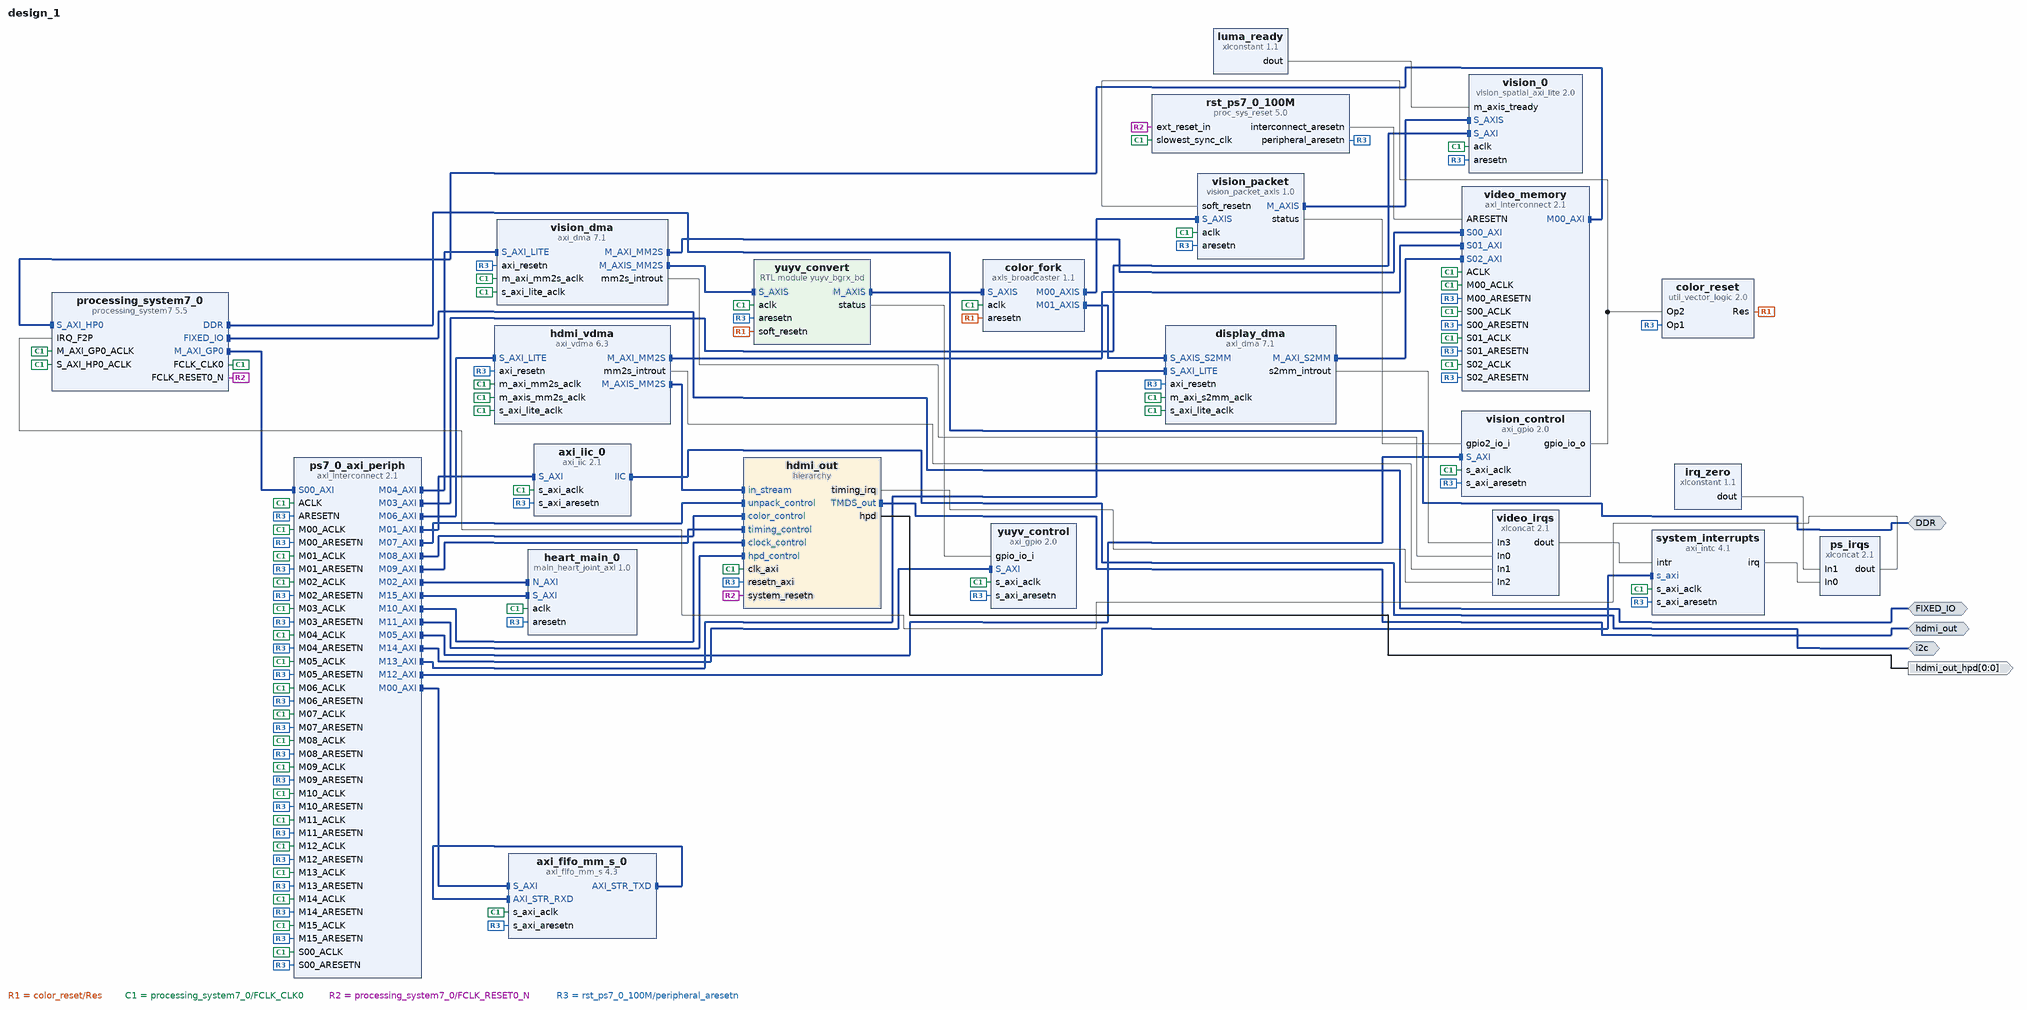
[diagram p0: block diagram of the top level]
# Vivado block design design_1, xc7z020clg400-1, Vivado 2024.1
create_bd_design design_1

create_bd_intf_port -mode Master -vlnv xilinx.com:interface:ddrx_rtl:1.0 DDR
create_bd_intf_port -mode Master -vlnv xilinx.com:display_processing_system7:fixedio_rtl:1.0 FIXED_IO
create_bd_intf_port -mode Master -vlnv xilinx.com:interface:iic_rtl:1.0 i2c
create_bd_intf_port -mode Master -vlnv digilentinc.com:interface:tmds_rtl:1.0 hdmi_out
create_bd_port -dir O -from 0 -to 0 hdmi_out_hpd

create_bd_cell -type ip -vlnv xilinx.com:ip:processing_system7:5.5 processing_system7_0
set_property -dict [list \
  CONFIG.PCW_APU_PERIPHERAL_FREQMHZ 650 \
  CONFIG.PCW_CRYSTAL_PERIPHERAL_FREQMHZ 50 \
  CONFIG.PCW_ENET0_ENET0_IO {MIO 16 .. 27} \
  CONFIG.PCW_ENET0_GRP_MDIO_ENABLE 1 \
  CONFIG.PCW_ENET0_GRP_MDIO_IO {MIO 52 .. 53} \
  CONFIG.PCW_ENET0_PERIPHERAL_ENABLE 1 \
  CONFIG.PCW_ENET0_RESET_ENABLE 1 \
  CONFIG.PCW_ENET0_RESET_IO {MIO 9} \
  CONFIG.PCW_ENET_RESET_ENABLE 1 \
  CONFIG.PCW_ENET_RESET_SELECT {Share reset pin} \
  CONFIG.PCW_FPGA0_PERIPHERAL_FREQMHZ 100 \
  CONFIG.PCW_FPGA1_PERIPHERAL_FREQMHZ 50 \
  CONFIG.PCW_GPIO_MIO_GPIO_ENABLE 1 \
  CONFIG.PCW_GPIO_MIO_GPIO_IO MIO \
  CONFIG.PCW_I2C_RESET_ENABLE 1 \
  CONFIG.PCW_IRQ_F2P_INTR 1 \
  CONFIG.PCW_PERIPHERAL_BOARD_PRESET None \
  CONFIG.PCW_PRESET_BANK1_VOLTAGE {LVCMOS 1.8V} \
  CONFIG.PCW_QSPI_GRP_FBCLK_ENABLE 1 \
  CONFIG.PCW_QSPI_GRP_FBCLK_IO {MIO 8} \
  CONFIG.PCW_QSPI_GRP_SINGLE_SS_ENABLE 1 \
  CONFIG.PCW_QSPI_GRP_SINGLE_SS_IO {MIO 1 .. 6} \
  CONFIG.PCW_QSPI_PERIPHERAL_ENABLE 1 \
  CONFIG.PCW_QSPI_QSPI_IO {MIO 1 .. 6} \
  CONFIG.PCW_SD0_GRP_CD_ENABLE 1 \
  CONFIG.PCW_SD0_GRP_CD_IO {MIO 47} \
  CONFIG.PCW_SD0_GRP_WP_ENABLE 0 \
  CONFIG.PCW_SD0_PERIPHERAL_ENABLE 1 \
  CONFIG.PCW_SD0_SD0_IO {MIO 40 .. 45} \
  CONFIG.PCW_SDIO_PERIPHERAL_FREQMHZ 50 \
  CONFIG.PCW_SINGLE_QSPI_DATA_MODE x4 \
  CONFIG.PCW_UART0_PERIPHERAL_ENABLE 1 \
  CONFIG.PCW_UART0_UART0_IO {MIO 14 .. 15} \
  CONFIG.PCW_UART1_PERIPHERAL_ENABLE 0 \
  CONFIG.PCW_UART_PERIPHERAL_FREQMHZ 100 \
  CONFIG.PCW_UIPARAM_DDR_BUS_WIDTH {16 Bit} \
  CONFIG.PCW_UIPARAM_DDR_FREQ_MHZ 525 \
  CONFIG.PCW_UIPARAM_DDR_PARTNO Custom \
  CONFIG.PCW_USB0_PERIPHERAL_ENABLE 1 \
  CONFIG.PCW_USB0_RESET_ENABLE 1 \
  CONFIG.PCW_USB0_RESET_IO {MIO 46} \
  CONFIG.PCW_USB0_USB0_IO {MIO 28 .. 39} \
  CONFIG.PCW_USB_RESET_ENABLE 1 \
  CONFIG.PCW_USB_RESET_SELECT {Share reset pin} \
  CONFIG.PCW_USE_FABRIC_INTERRUPT 1 \
  CONFIG.PCW_USE_S_AXI_HP0 1 \
] [get_bd_cells processing_system7_0]
# 494 more settings of processing_system7_0 are not shown: defaults, MIO pin electricals, DDR timing, and values the tool derives
create_bd_cell -type ip -vlnv xilinx.com:ip:axi_fifo_mm_s:4.3 axi_fifo_mm_s_0
create_bd_cell -type ip -vlnv xilinx.com:ip:axi_interconnect:2.1 ps7_0_axi_periph
set_property -dict {CONFIG.NUM_MI 16} [get_bd_cells ps7_0_axi_periph]
create_bd_cell -type ip -vlnv xilinx.com:ip:proc_sys_reset:5.0 rst_ps7_0_100M
create_bd_cell -type ip -vlnv xilinx.com:ip:axi_iic:2.1 axi_iic_0
set_property -dict {CONFIG.IIC_BOARD_INTERFACE i2c CONFIG.USE_BOARD_FLOW true} [get_bd_cells axi_iic_0]
create_bd_cell -type hier hdmi_out
create_bd_cell -type ip -vlnv xilinx.com:ip:axi_dma:7.1 vision_dma
set_property -dict [list \
  CONFIG.c_include_s2mm 0 \
  CONFIG.c_include_sg 0 \
  CONFIG.c_m_axi_mm2s_data_width 32 \
  CONFIG.c_m_axis_mm2s_tdata_width 32 \
  CONFIG.c_mm2s_burst_size 32 \
  CONFIG.c_sg_length_width 23 \
] [get_bd_cells vision_dma]
create_bd_cell -type ip -vlnv v3b25.local:vision:vision_packet_axis:1.0 vision_packet
create_bd_cell -type ip -vlnv xilinx.com:ip:axi_gpio:2.0 vision_control
set_property -dict [list \
  CONFIG.C_ALL_INPUTS_2 1 \
  CONFIG.C_ALL_OUTPUTS 1 \
  CONFIG.C_DOUT_DEFAULT 0x00000000 \
  CONFIG.C_GPIO2_WIDTH 32 \
  CONFIG.C_GPIO_WIDTH 1 \
  CONFIG.C_INTERRUPT_PRESENT 0 \
  CONFIG.C_IS_DUAL 1 \
] [get_bd_cells vision_control]
create_bd_cell -type ip -vlnv xilinx.com:ip:axi_vdma:6.3 hdmi_vdma
set_property -dict [list \
  CONFIG.c_include_s2mm 0 \
  CONFIG.c_m_axi_mm2s_data_width 32 \
  CONFIG.c_m_axis_mm2s_tdata_width 32 \
  CONFIG.c_mm2s_genlock_mode 1 \
  CONFIG.c_mm2s_linebuffer_depth 512 \
  CONFIG.c_mm2s_max_burst_length 32 \
  CONFIG.c_num_fstores 4 \
] [get_bd_cells hdmi_vdma]
create_bd_cell -type ip -vlnv xilinx.com:ip:axi_interconnect:2.1 video_memory
set_property -dict {CONFIG.NUM_MI 1 CONFIG.NUM_SI 3} [get_bd_cells video_memory]
create_bd_cell -type ip -vlnv xilinx.com:ip:axi_intc:4.1 system_interrupts
set_property -dict {CONFIG.C_IRQ_CONNECTION 1} [get_bd_cells system_interrupts]
create_bd_cell -type ip -vlnv xilinx.com:ip:xlconcat:2.1 video_irqs
set_property -dict {CONFIG.NUM_PORTS 4} [get_bd_cells video_irqs]
create_bd_cell -type ip -vlnv xilinx.com:ip:xlconcat:2.1 ps_irqs
set_property -dict {CONFIG.IN1_WIDTH 15 CONFIG.NUM_PORTS 2} [get_bd_cells ps_irqs]
create_bd_cell -type ip -vlnv xilinx.com:ip:xlconstant:1.1 irq_zero
set_property -dict {CONFIG.CONST_VAL 0 CONFIG.CONST_WIDTH 15} [get_bd_cells irq_zero]
create_bd_cell -type ip -vlnv xilinx.com:ip:xlconstant:1.1 luma_ready
set_property -dict {CONFIG.CONST_VAL 1} [get_bd_cells luma_ready]
create_bd_cell -type module -reference yuyv_bgrx_bd yuyv_convert
create_bd_cell -type ip -vlnv xilinx.com:ip:axis_broadcaster:1.1 color_fork
set_property -dict [list \
  CONFIG.HAS_TKEEP 1 \
  CONFIG.HAS_TLAST 1 \
  CONFIG.M00_TDATA_REMAP {tdata[31:0]} \
  CONFIG.M01_TDATA_REMAP {tdata[31:0]} \
  CONFIG.M_TDATA_NUM_BYTES 4 \
  CONFIG.NUM_MI 2 \
  CONFIG.S_TDATA_NUM_BYTES 4 \
] [get_bd_cells color_fork]
create_bd_cell -type ip -vlnv xilinx.com:ip:axi_dma:7.1 display_dma
set_property -dict [list \
  CONFIG.c_include_mm2s 0 \
  CONFIG.c_include_s2mm 1 \
  CONFIG.c_include_sg 0 \
  CONFIG.c_m_axi_s2mm_data_width 32 \
  CONFIG.c_s2mm_burst_size 32 \
  CONFIG.c_s_axis_s2mm_tdata_width 32 \
  CONFIG.c_sg_length_width 23 \
] [get_bd_cells display_dma]
create_bd_cell -type ip -vlnv xilinx.com:ip:axi_gpio:2.0 yuyv_control
set_property -dict {CONFIG.C_ALL_INPUTS 1 CONFIG.C_GPIO_WIDTH 32 CONFIG.C_INTERRUPT_PRESENT 0} [get_bd_cells yuyv_control]
create_bd_cell -type ip -vlnv xilinx.com:ip:util_vector_logic:2.0 color_reset
set_property -dict {CONFIG.C_OPERATION and CONFIG.C_SIZE 1} [get_bd_cells color_reset]
create_bd_cell -type ip -vlnv v3b25.local:signal:main_heart_joint_axi:1.0 heart_main_0
set_property -dict {CONFIG.WATCHDOG_CYCLES 2000000} [get_bd_cells heart_main_0]
create_bd_cell -type ip -vlnv v3b25.local:vision:vision_spatial_axi_lite:2.0 vision_0

# ---- hierarchy /hdmi_out ----
current_bd_instance /hdmi_out
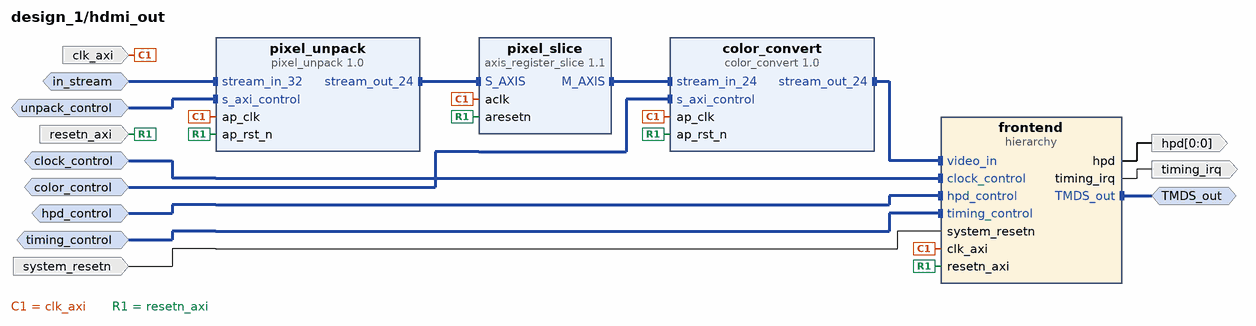
[diagram p1: block diagram inside /hdmi_out]
create_bd_intf_pin -mode Slave -vlnv xilinx.com:interface:aximm_rtl:1.0 hpd_control
create_bd_intf_pin -mode Slave -vlnv xilinx.com:interface:aximm_rtl:1.0 unpack_control
create_bd_intf_pin -mode Slave -vlnv xilinx.com:interface:aximm_rtl:1.0 color_control
create_bd_intf_pin -mode Slave -vlnv xilinx.com:interface:aximm_rtl:1.0 timing_control
create_bd_intf_pin -mode Slave -vlnv xilinx.com:interface:aximm_rtl:1.0 clock_control
create_bd_intf_pin -mode Slave -vlnv xilinx.com:interface:axis_rtl:1.0 in_stream
create_bd_intf_pin -mode Master -vlnv digilentinc.com:interface:tmds_rtl:1.0 TMDS_out
create_bd_pin -dir I -type clk clk_axi
create_bd_pin -dir I -type rst resetn_axi
create_bd_pin -dir I -type rst system_resetn
create_bd_pin -dir O -type intr timing_irq
create_bd_pin -dir O -from 0 -to 0 hpd

create_bd_cell -type ip -vlnv xilinx.com:hls:pixel_unpack:1.0 pixel_unpack
create_bd_cell -type ip -vlnv xilinx.com:hls:color_convert:1.0 color_convert
create_bd_cell -type ip -vlnv xilinx.com:ip:axis_register_slice:1.1 pixel_slice
set_property -dict {CONFIG.TUSER_WIDTH 1} [get_bd_cells pixel_slice]
create_bd_cell -type hier frontend

# ---- hierarchy /hdmi_out/frontend ----
current_bd_instance /hdmi_out/frontend
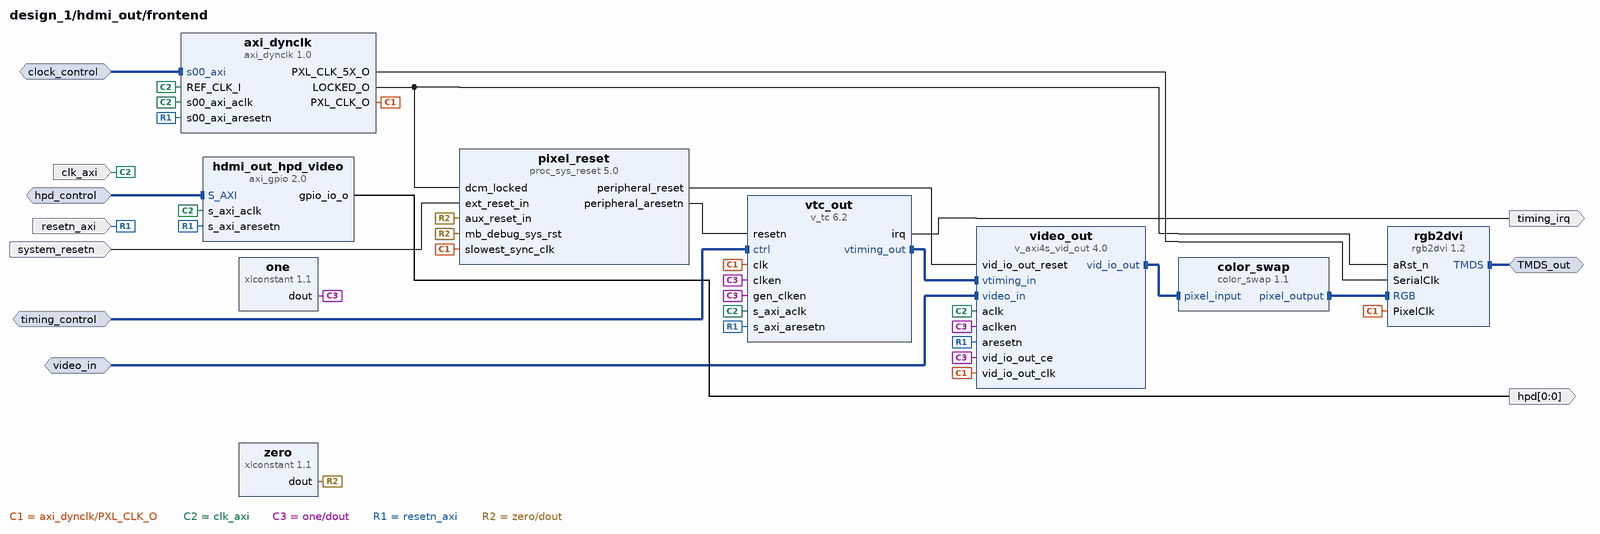
[diagram p2: block diagram inside /hdmi_out/frontend]
create_bd_intf_pin -mode Slave -vlnv xilinx.com:interface:aximm_rtl:1.0 hpd_control
create_bd_intf_pin -mode Slave -vlnv xilinx.com:interface:aximm_rtl:1.0 timing_control
create_bd_intf_pin -mode Slave -vlnv xilinx.com:interface:aximm_rtl:1.0 clock_control
create_bd_intf_pin -mode Slave -vlnv xilinx.com:interface:axis_rtl:1.0 video_in
create_bd_intf_pin -mode Master -vlnv digilentinc.com:interface:tmds_rtl:1.0 TMDS_out
create_bd_pin -dir I -type clk clk_axi
create_bd_pin -dir I -type rst resetn_axi
create_bd_pin -dir I -type rst system_resetn
create_bd_pin -dir O -type intr timing_irq
create_bd_pin -dir O -from 0 -to 0 hpd

create_bd_cell -type ip -vlnv digilentinc.com:ip:axi_dynclk:1.0 axi_dynclk
create_bd_cell -type ip -vlnv xilinx.com:user:color_swap:1.1 color_swap
create_bd_cell -type ip -vlnv xilinx.com:ip:axi_gpio:2.0 hdmi_out_hpd_video
set_property -dict {CONFIG.C_ALL_OUTPUTS 1 CONFIG.C_GPIO_WIDTH 1 CONFIG.C_INTERRUPT_PRESENT 0} [get_bd_cells hdmi_out_hpd_video]
create_bd_cell -type ip -vlnv digilentinc.com:ip:rgb2dvi:1.2 rgb2dvi
set_property -dict {CONFIG.kClkRange 2 CONFIG.kGenerateSerialClk false CONFIG.kRstActiveHigh false} [get_bd_cells rgb2dvi]
create_bd_cell -type ip -vlnv xilinx.com:ip:v_axi4s_vid_out:4.0 video_out
set_property -dict [list \
  CONFIG.C_ADDR_WIDTH 11 \
  CONFIG.C_HAS_ASYNC_CLK 1 \
  CONFIG.C_HYSTERESIS_LEVEL 1024 \
  CONFIG.C_VTG_MASTER_SLAVE 1 \
] [get_bd_cells video_out]
create_bd_cell -type ip -vlnv xilinx.com:ip:v_tc:6.2 vtc_out
set_property -dict {CONFIG.enable_detection false} [get_bd_cells vtc_out]
create_bd_cell -type ip -vlnv xilinx.com:ip:proc_sys_reset:5.0 pixel_reset
set_property -dict {CONFIG.C_AUX_RESET_HIGH 1} [get_bd_cells pixel_reset]
create_bd_cell -type ip -vlnv xilinx.com:ip:xlconstant:1.1 one
set_property -dict {CONFIG.CONST_VAL 1} [get_bd_cells one]
create_bd_cell -type ip -vlnv xilinx.com:ip:xlconstant:1.1 zero
set_property -dict {CONFIG.CONST_VAL 0} [get_bd_cells zero]

# ---- connections ----

current_bd_instance /hdmi_out
connect_bd_intf_net [get_bd_intf_pins clock_control] [get_bd_intf_pins frontend/clock_control]
connect_bd_intf_net [get_bd_intf_pins color_control] [get_bd_intf_pins color_convert/s_axi_control]
connect_bd_intf_net [get_bd_intf_pins color_convert/stream_out_24] [get_bd_intf_pins frontend/video_in]
connect_bd_intf_net [get_bd_intf_pins frontend/TMDS_out] [get_bd_intf_pins TMDS_out]
connect_bd_intf_net [get_bd_intf_pins hpd_control] [get_bd_intf_pins frontend/hpd_control]
connect_bd_intf_net [get_bd_intf_pins in_stream] [get_bd_intf_pins pixel_unpack/stream_in_32]
connect_bd_intf_net [get_bd_intf_pins pixel_slice/M_AXIS] [get_bd_intf_pins color_convert/stream_in_24]
connect_bd_intf_net [get_bd_intf_pins pixel_unpack/stream_out_24] [get_bd_intf_pins pixel_slice/S_AXIS]
connect_bd_intf_net [get_bd_intf_pins timing_control] [get_bd_intf_pins frontend/timing_control]
connect_bd_intf_net [get_bd_intf_pins unpack_control] [get_bd_intf_pins pixel_unpack/s_axi_control]
connect_bd_net [get_bd_pins clk_axi] \
  [get_bd_pins frontend/clk_axi] [get_bd_pins pixel_unpack/ap_clk] [get_bd_pins color_convert/ap_clk] \
  [get_bd_pins pixel_slice/aclk]
connect_bd_net [get_bd_pins frontend/hpd] [get_bd_pins hpd]
connect_bd_net [get_bd_pins frontend/timing_irq] [get_bd_pins timing_irq]
connect_bd_net [get_bd_pins resetn_axi] \
  [get_bd_pins frontend/resetn_axi] [get_bd_pins pixel_unpack/ap_rst_n] [get_bd_pins color_convert/ap_rst_n] \
  [get_bd_pins pixel_slice/aresetn]
connect_bd_net [get_bd_pins system_resetn] [get_bd_pins frontend/system_resetn]

current_bd_instance /hdmi_out/frontend
connect_bd_intf_net [get_bd_intf_pins clock_control] [get_bd_intf_pins axi_dynclk/s00_axi]
connect_bd_intf_net [get_bd_intf_pins color_swap/pixel_output] [get_bd_intf_pins rgb2dvi/RGB]
connect_bd_intf_net [get_bd_intf_pins hpd_control] [get_bd_intf_pins hdmi_out_hpd_video/S_AXI]
connect_bd_intf_net [get_bd_intf_pins rgb2dvi/TMDS] [get_bd_intf_pins TMDS_out]
connect_bd_intf_net [get_bd_intf_pins timing_control] [get_bd_intf_pins vtc_out/ctrl]
connect_bd_intf_net [get_bd_intf_pins video_in] [get_bd_intf_pins video_out/video_in]
connect_bd_intf_net [get_bd_intf_pins video_out/vid_io_out] [get_bd_intf_pins color_swap/pixel_input]
connect_bd_intf_net [get_bd_intf_pins vtc_out/vtiming_out] [get_bd_intf_pins video_out/vtiming_in]
connect_bd_net [get_bd_pins axi_dynclk/LOCKED_O] [get_bd_pins rgb2dvi/aRst_n] [get_bd_pins pixel_reset/dcm_locked]
connect_bd_net [get_bd_pins axi_dynclk/PXL_CLK_5X_O] [get_bd_pins rgb2dvi/SerialClk]
connect_bd_net [get_bd_pins axi_dynclk/PXL_CLK_O] \
  [get_bd_pins pixel_reset/slowest_sync_clk] [get_bd_pins rgb2dvi/PixelClk] [get_bd_pins video_out/vid_io_out_clk] \
  [get_bd_pins vtc_out/clk]
connect_bd_net [get_bd_pins clk_axi] \
  [get_bd_pins axi_dynclk/REF_CLK_I] [get_bd_pins axi_dynclk/s00_axi_aclk] [get_bd_pins hdmi_out_hpd_video/s_axi_aclk] \
  [get_bd_pins vtc_out/s_axi_aclk] [get_bd_pins video_out/aclk]
connect_bd_net [get_bd_pins hdmi_out_hpd_video/gpio_io_o] [get_bd_pins hpd]
connect_bd_net [get_bd_pins one/dout] \
  [get_bd_pins video_out/aclken] [get_bd_pins video_out/vid_io_out_ce] [get_bd_pins vtc_out/clken] \
  [get_bd_pins vtc_out/gen_clken]
connect_bd_net [get_bd_pins pixel_reset/peripheral_aresetn] [get_bd_pins vtc_out/resetn]
connect_bd_net [get_bd_pins pixel_reset/peripheral_reset] [get_bd_pins video_out/vid_io_out_reset]
connect_bd_net [get_bd_pins resetn_axi] \
  [get_bd_pins axi_dynclk/s00_axi_aresetn] [get_bd_pins hdmi_out_hpd_video/s_axi_aresetn] [get_bd_pins vtc_out/s_axi_aresetn] \
  [get_bd_pins video_out/aresetn]
connect_bd_net [get_bd_pins system_resetn] [get_bd_pins pixel_reset/ext_reset_in]
connect_bd_net [get_bd_pins vtc_out/irq] [get_bd_pins timing_irq]
connect_bd_net [get_bd_pins zero/dout] [get_bd_pins pixel_reset/aux_reset_in] [get_bd_pins pixel_reset/mb_debug_sys_rst]

current_bd_instance /
connect_bd_intf_net [get_bd_intf_pins axi_fifo_mm_s_0/AXI_STR_TXD] [get_bd_intf_pins axi_fifo_mm_s_0/AXI_STR_RXD]
connect_bd_intf_net [get_bd_intf_ports i2c] [get_bd_intf_pins axi_iic_0/IIC]
connect_bd_intf_net [get_bd_intf_pins color_fork/M00_AXIS] [get_bd_intf_pins vision_packet/S_AXIS]
connect_bd_intf_net [get_bd_intf_pins color_fork/M01_AXIS] [get_bd_intf_pins display_dma/S_AXIS_S2MM]
connect_bd_intf_net [get_bd_intf_pins display_dma/M_AXI_S2MM] [get_bd_intf_pins video_memory/S02_AXI]
connect_bd_intf_net [get_bd_intf_ports hdmi_out] [get_bd_intf_pins hdmi_out/TMDS_out]
connect_bd_intf_net [get_bd_intf_pins hdmi_vdma/M_AXIS_MM2S] [get_bd_intf_pins hdmi_out/in_stream]
connect_bd_intf_net [get_bd_intf_pins hdmi_vdma/M_AXI_MM2S] [get_bd_intf_pins video_memory/S01_AXI]
connect_bd_intf_net [get_bd_intf_ports DDR] [get_bd_intf_pins processing_system7_0/DDR]
connect_bd_intf_net [get_bd_intf_ports FIXED_IO] [get_bd_intf_pins processing_system7_0/FIXED_IO]
connect_bd_intf_net [get_bd_intf_pins processing_system7_0/M_AXI_GP0] [get_bd_intf_pins ps7_0_axi_periph/S00_AXI]
connect_bd_intf_net [get_bd_intf_pins ps7_0_axi_periph/M00_AXI] [get_bd_intf_pins axi_fifo_mm_s_0/S_AXI]
connect_bd_intf_net [get_bd_intf_pins ps7_0_axi_periph/M01_AXI] [get_bd_intf_pins axi_iic_0/S_AXI]
connect_bd_intf_net [get_bd_intf_pins ps7_0_axi_periph/M02_AXI] [get_bd_intf_pins heart_main_0/N_AXI]
connect_bd_intf_net [get_bd_intf_pins ps7_0_axi_periph/M03_AXI] [get_bd_intf_pins vision_0/S_AXI]
connect_bd_intf_net [get_bd_intf_pins ps7_0_axi_periph/M04_AXI] [get_bd_intf_pins vision_dma/S_AXI_LITE]
connect_bd_intf_net [get_bd_intf_pins ps7_0_axi_periph/M05_AXI] [get_bd_intf_pins vision_control/S_AXI]
connect_bd_intf_net [get_bd_intf_pins ps7_0_axi_periph/M06_AXI] [get_bd_intf_pins hdmi_vdma/S_AXI_LITE]
connect_bd_intf_net [get_bd_intf_pins ps7_0_axi_periph/M07_AXI] [get_bd_intf_pins hdmi_out/unpack_control]
connect_bd_intf_net [get_bd_intf_pins ps7_0_axi_periph/M08_AXI] [get_bd_intf_pins hdmi_out/color_control]
connect_bd_intf_net [get_bd_intf_pins ps7_0_axi_periph/M09_AXI] [get_bd_intf_pins hdmi_out/timing_control]
connect_bd_intf_net [get_bd_intf_pins ps7_0_axi_periph/M10_AXI] [get_bd_intf_pins hdmi_out/clock_control]
connect_bd_intf_net [get_bd_intf_pins ps7_0_axi_periph/M11_AXI] [get_bd_intf_pins hdmi_out/hpd_control]
connect_bd_intf_net [get_bd_intf_pins ps7_0_axi_periph/M12_AXI] [get_bd_intf_pins system_interrupts/s_axi]
connect_bd_intf_net [get_bd_intf_pins ps7_0_axi_periph/M13_AXI] [get_bd_intf_pins display_dma/S_AXI_LITE]
connect_bd_intf_net [get_bd_intf_pins ps7_0_axi_periph/M14_AXI] [get_bd_intf_pins yuyv_control/S_AXI]
connect_bd_intf_net [get_bd_intf_pins ps7_0_axi_periph/M15_AXI] [get_bd_intf_pins heart_main_0/S_AXI]
connect_bd_intf_net [get_bd_intf_pins video_memory/M00_AXI] [get_bd_intf_pins processing_system7_0/S_AXI_HP0]
connect_bd_intf_net [get_bd_intf_pins vision_dma/M_AXIS_MM2S] [get_bd_intf_pins yuyv_convert/S_AXIS]
connect_bd_intf_net [get_bd_intf_pins vision_dma/M_AXI_MM2S] [get_bd_intf_pins video_memory/S00_AXI]
connect_bd_intf_net [get_bd_intf_pins vision_packet/M_AXIS] [get_bd_intf_pins vision_0/S_AXIS]
connect_bd_intf_net [get_bd_intf_pins yuyv_convert/M_AXIS] [get_bd_intf_pins color_fork/S_AXIS]
connect_bd_net [get_bd_pins color_reset/Res] [get_bd_pins yuyv_convert/soft_resetn] [get_bd_pins color_fork/aresetn]
connect_bd_net [get_bd_pins display_dma/s2mm_introut] [get_bd_pins video_irqs/In3]
connect_bd_net [get_bd_pins hdmi_out/hpd] [get_bd_ports hdmi_out_hpd]
connect_bd_net [get_bd_pins hdmi_out/timing_irq] [get_bd_pins video_irqs/In2]
connect_bd_net [get_bd_pins hdmi_vdma/mm2s_introut] [get_bd_pins video_irqs/In1]
connect_bd_net [get_bd_pins irq_zero/dout] [get_bd_pins ps_irqs/In1]
connect_bd_net [get_bd_pins luma_ready/dout] [get_bd_pins vision_0/m_axis_tready]
connect_bd_net [get_bd_pins processing_system7_0/FCLK_CLK0] \
  [get_bd_pins processing_system7_0/M_AXI_GP0_ACLK] [get_bd_pins ps7_0_axi_periph/S00_ACLK] \
  [get_bd_pins rst_ps7_0_100M/slowest_sync_clk] [get_bd_pins axi_fifo_mm_s_0/s_axi_aclk] \
  [get_bd_pins ps7_0_axi_periph/M00_ACLK] [get_bd_pins ps7_0_axi_periph/ACLK] [get_bd_pins axi_iic_0/s_axi_aclk] \
  [get_bd_pins ps7_0_axi_periph/M01_ACLK] [get_bd_pins ps7_0_axi_periph/M02_ACLK] [get_bd_pins ps7_0_axi_periph/M03_ACLK] \
  [get_bd_pins vision_dma/s_axi_lite_aclk] [get_bd_pins ps7_0_axi_periph/M04_ACLK] [get_bd_pins vision_control/s_axi_aclk] \
  [get_bd_pins ps7_0_axi_periph/M05_ACLK] [get_bd_pins hdmi_vdma/s_axi_lite_aclk] [get_bd_pins ps7_0_axi_periph/M06_ACLK] \
  [get_bd_pins hdmi_out/clk_axi] [get_bd_pins ps7_0_axi_periph/M07_ACLK] [get_bd_pins ps7_0_axi_periph/M08_ACLK] \
  [get_bd_pins ps7_0_axi_periph/M09_ACLK] [get_bd_pins ps7_0_axi_periph/M10_ACLK] [get_bd_pins ps7_0_axi_periph/M11_ACLK] \
  [get_bd_pins system_interrupts/s_axi_aclk] [get_bd_pins ps7_0_axi_periph/M12_ACLK] [get_bd_pins vision_packet/aclk] \
  [get_bd_pins vision_dma/m_axi_mm2s_aclk] [get_bd_pins hdmi_vdma/m_axi_mm2s_aclk] [get_bd_pins hdmi_vdma/m_axis_mm2s_aclk] \
  [get_bd_pins video_memory/ACLK] [get_bd_pins video_memory/S00_ACLK] [get_bd_pins video_memory/S01_ACLK] \
  [get_bd_pins video_memory/M00_ACLK] [get_bd_pins processing_system7_0/S_AXI_HP0_ACLK] [get_bd_pins yuyv_convert/aclk] \
  [get_bd_pins color_fork/aclk] [get_bd_pins display_dma/s_axi_lite_aclk] [get_bd_pins display_dma/m_axi_s2mm_aclk] \
  [get_bd_pins yuyv_control/s_axi_aclk] [get_bd_pins ps7_0_axi_periph/M13_ACLK] [get_bd_pins ps7_0_axi_periph/M14_ACLK] \
  [get_bd_pins video_memory/S02_ACLK] [get_bd_pins ps7_0_axi_periph/M15_ACLK] [get_bd_pins heart_main_0/aclk] \
  [get_bd_pins vision_0/aclk]
connect_bd_net [get_bd_pins processing_system7_0/FCLK_RESET0_N] [get_bd_pins rst_ps7_0_100M/ext_reset_in] [get_bd_pins hdmi_out/system_resetn]
connect_bd_net [get_bd_pins ps_irqs/dout] [get_bd_pins processing_system7_0/IRQ_F2P]
connect_bd_net [get_bd_pins rst_ps7_0_100M/interconnect_aresetn] [get_bd_pins video_memory/ARESETN]
connect_bd_net [get_bd_pins rst_ps7_0_100M/peripheral_aresetn] \
  [get_bd_pins ps7_0_axi_periph/S00_ARESETN] [get_bd_pins axi_fifo_mm_s_0/s_axi_aresetn] \
  [get_bd_pins ps7_0_axi_periph/M00_ARESETN] [get_bd_pins ps7_0_axi_periph/ARESETN] [get_bd_pins axi_iic_0/s_axi_aresetn] \
  [get_bd_pins ps7_0_axi_periph/M01_ARESETN] [get_bd_pins ps7_0_axi_periph/M02_ARESETN] \
  [get_bd_pins ps7_0_axi_periph/M03_ARESETN] [get_bd_pins vision_dma/axi_resetn] [get_bd_pins ps7_0_axi_periph/M04_ARESETN] \
  [get_bd_pins vision_control/s_axi_aresetn] [get_bd_pins ps7_0_axi_periph/M05_ARESETN] [get_bd_pins hdmi_vdma/axi_resetn] \
  [get_bd_pins ps7_0_axi_periph/M06_ARESETN] [get_bd_pins hdmi_out/resetn_axi] [get_bd_pins ps7_0_axi_periph/M07_ARESETN] \
  [get_bd_pins ps7_0_axi_periph/M08_ARESETN] [get_bd_pins ps7_0_axi_periph/M09_ARESETN] \
  [get_bd_pins ps7_0_axi_periph/M10_ARESETN] [get_bd_pins ps7_0_axi_periph/M11_ARESETN] \
  [get_bd_pins system_interrupts/s_axi_aresetn] [get_bd_pins ps7_0_axi_periph/M12_ARESETN] \
  [get_bd_pins vision_packet/aresetn] [get_bd_pins video_memory/S00_ARESETN] [get_bd_pins video_memory/S01_ARESETN] \
  [get_bd_pins video_memory/M00_ARESETN] [get_bd_pins yuyv_convert/aresetn] [get_bd_pins display_dma/axi_resetn] \
  [get_bd_pins yuyv_control/s_axi_aresetn] [get_bd_pins ps7_0_axi_periph/M13_ARESETN] \
  [get_bd_pins ps7_0_axi_periph/M14_ARESETN] [get_bd_pins video_memory/S02_ARESETN] [get_bd_pins color_reset/Op1] \
  [get_bd_pins ps7_0_axi_periph/M15_ARESETN] [get_bd_pins heart_main_0/aresetn] [get_bd_pins vision_0/aresetn]
connect_bd_net [get_bd_pins system_interrupts/irq] [get_bd_pins ps_irqs/In0]
connect_bd_net [get_bd_pins video_irqs/dout] [get_bd_pins system_interrupts/intr]
connect_bd_net [get_bd_pins vision_control/gpio_io_o] [get_bd_pins vision_packet/soft_resetn] [get_bd_pins color_reset/Op2]
connect_bd_net [get_bd_pins vision_dma/mm2s_introut] [get_bd_pins video_irqs/In0]
connect_bd_net [get_bd_pins vision_packet/status] [get_bd_pins vision_control/gpio2_io_i]
connect_bd_net [get_bd_pins yuyv_convert/status] [get_bd_pins yuyv_control/gpio_io_i]

# ---- address map ----
assign_bd_address -offset 0x00000000 -range 512M -target_address_space [get_bd_addr_spaces display_dma/Data_S2MM] [get_bd_addr_segs processing_system7_0/S_AXI_HP0/HP0_DDR_LOWOCM]
assign_bd_address -offset 0x00000000 -range 512M -target_address_space [get_bd_addr_spaces hdmi_vdma/Data_MM2S] [get_bd_addr_segs processing_system7_0/S_AXI_HP0/HP0_DDR_LOWOCM]
assign_bd_address -offset 0x41230000 -range 64K -target_address_space [get_bd_addr_spaces processing_system7_0/Data] [get_bd_addr_segs hdmi_out/frontend/hdmi_out_hpd_video/S_AXI/Reg]
assign_bd_address -offset 0x41240000 -range 64K -target_address_space [get_bd_addr_spaces processing_system7_0/Data] [get_bd_addr_segs vision_control/S_AXI/Reg]
assign_bd_address -offset 0x41250000 -range 64K -target_address_space [get_bd_addr_spaces processing_system7_0/Data] [get_bd_addr_segs yuyv_control/S_AXI/Reg]
assign_bd_address -offset 0x41600000 -range 64K -target_address_space [get_bd_addr_spaces processing_system7_0/Data] [get_bd_addr_segs axi_iic_0/S_AXI/Reg]
assign_bd_address -offset 0x41800000 -range 64K -target_address_space [get_bd_addr_spaces processing_system7_0/Data] [get_bd_addr_segs system_interrupts/S_AXI/Reg]
assign_bd_address -offset 0x43000000 -range 64K -target_address_space [get_bd_addr_spaces processing_system7_0/Data] [get_bd_addr_segs hdmi_vdma/S_AXI_LITE/Reg]
assign_bd_address -offset 0x43C00000 -range 64K -target_address_space [get_bd_addr_spaces processing_system7_0/Data] [get_bd_addr_segs axi_fifo_mm_s_0/S_AXI/Mem0]
assign_bd_address -offset 0x43C10000 -range 64K -target_address_space [get_bd_addr_spaces processing_system7_0/Data] [get_bd_addr_segs heart_main_0/N_AXI/Reg]
assign_bd_address -offset 0x43C20000 -range 64K -target_address_space [get_bd_addr_spaces processing_system7_0/Data] [get_bd_addr_segs hdmi_out/frontend/vtc_out/ctrl/Reg]
assign_bd_address -offset 0x43C60000 -range 64K -target_address_space [get_bd_addr_spaces processing_system7_0/Data] [get_bd_addr_segs hdmi_out/color_convert/s_axi_control/Reg]
assign_bd_address -offset 0x43C70000 -range 64K -target_address_space [get_bd_addr_spaces processing_system7_0/Data] [get_bd_addr_segs hdmi_out/pixel_unpack/s_axi_control/Reg]
assign_bd_address -offset 0x43C80000 -range 64K -target_address_space [get_bd_addr_spaces processing_system7_0/Data] [get_bd_addr_segs vision_0/S_AXI/Reg]
assign_bd_address -offset 0x43C90000 -range 64K -target_address_space [get_bd_addr_spaces processing_system7_0/Data] [get_bd_addr_segs hdmi_out/frontend/axi_dynclk/s00_axi/reg0]
assign_bd_address -offset 0x43CA0000 -range 64K -target_address_space [get_bd_addr_spaces processing_system7_0/Data] [get_bd_addr_segs heart_main_0/S_AXI/Reg]
assign_bd_address -offset 0x44A00000 -range 64K -target_address_space [get_bd_addr_spaces processing_system7_0/Data] [get_bd_addr_segs vision_dma/S_AXI_LITE/Reg]
assign_bd_address -offset 0x44A10000 -range 64K -target_address_space [get_bd_addr_spaces processing_system7_0/Data] [get_bd_addr_segs display_dma/S_AXI_LITE/Reg]
assign_bd_address -offset 0x00000000 -range 512M -target_address_space [get_bd_addr_spaces vision_dma/Data_MM2S] [get_bd_addr_segs processing_system7_0/S_AXI_HP0/HP0_DDR_LOWOCM]

validate_bd_design
save_bd_design
